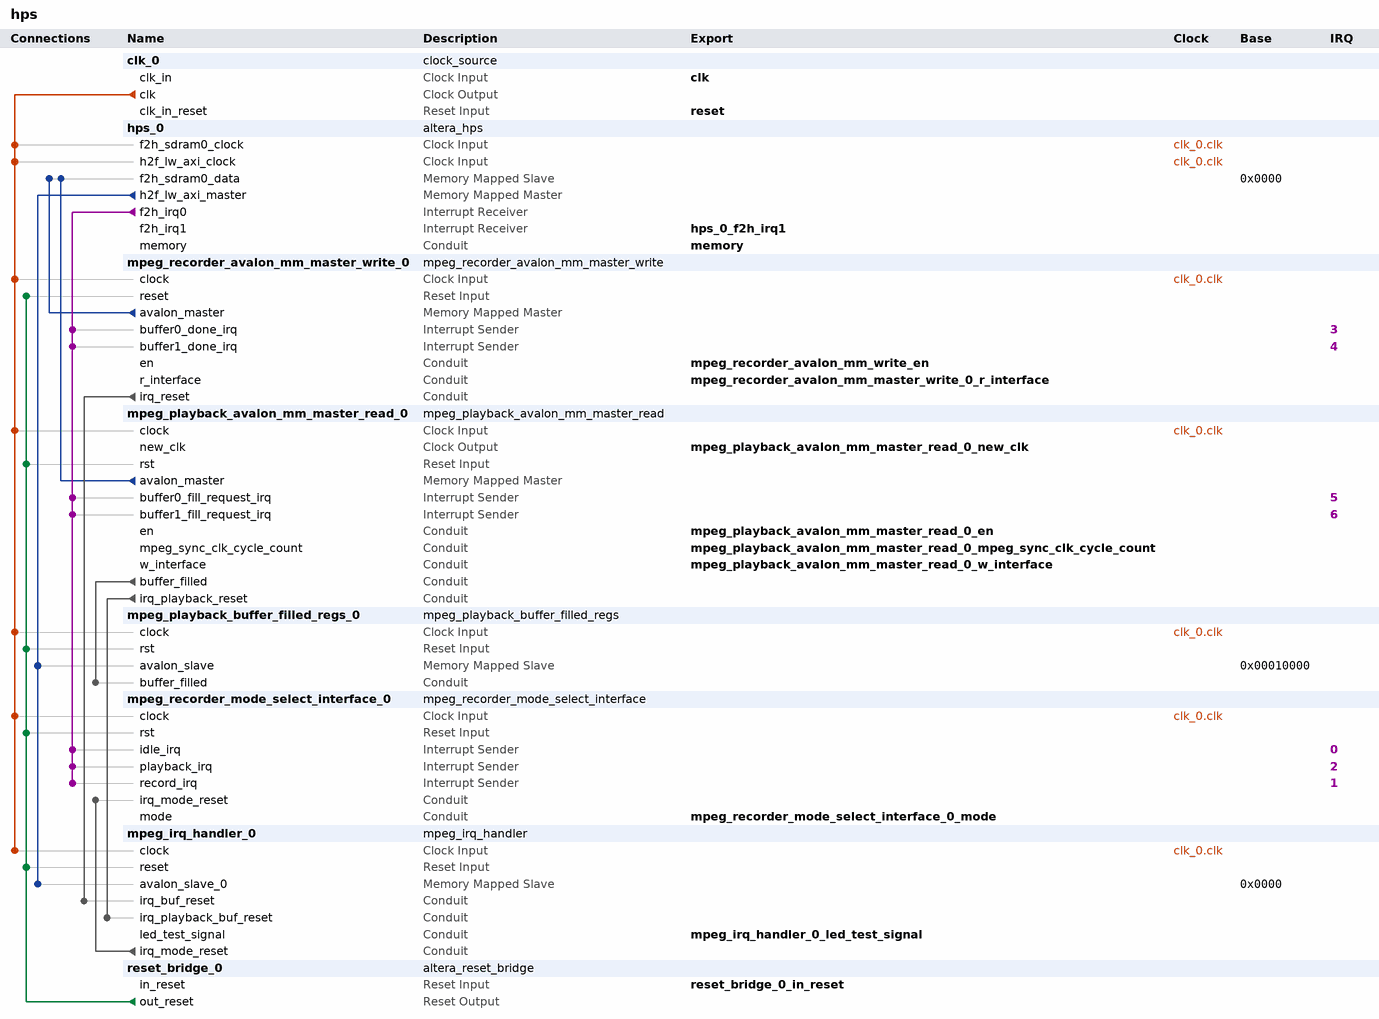
[diagram p0: system contents]
# Platform Designer (Qsys) system hps, Cyclone V 5CSEMA5F31C6
# Parameters at their usual value, and those the tool derives, are not listed.
package require -exact qsys 22.1
create_system hps
set_project_property DEVICE_FAMILY {Cyclone V}
set_project_property DEVICE 5CSEMA5F31C6

add_instance clk_0 clock_source 22.1
set_instance_parameter_value clk_0 clockFrequency 100000000

add_instance hps_0 altera_hps 22.1
set_instance_parameter_value hps_0 EMAC1_Mode N/A
set_instance_parameter_value hps_0 EMAC1_PinMuxing Unused
set_instance_parameter_value hps_0 F2SCLK_COLDRST_Enable false
set_instance_parameter_value hps_0 F2SCLK_DBGRST_Enable false
set_instance_parameter_value hps_0 F2SCLK_WARMRST_Enable false
set_instance_parameter_value hps_0 F2SDRAM_Type {Avalon-MM Bidirectional}
set_instance_parameter_value hps_0 F2SDRAM_Width 32
set_instance_parameter_value hps_0 F2SINTERRUPT_Enable true
set_instance_parameter_value hps_0 F2S_Width 0
set_instance_parameter_value hps_0 FPGA_PERIPHERAL_OUTPUT_CLOCK_FREQ_EMAC0_GTX_CLK 100
set_instance_parameter_value hps_0 FPGA_PERIPHERAL_OUTPUT_CLOCK_FREQ_EMAC0_MD_CLK 100.0
set_instance_parameter_value hps_0 FPGA_PERIPHERAL_OUTPUT_CLOCK_FREQ_EMAC1_GTX_CLK 100
set_instance_parameter_value hps_0 FPGA_PERIPHERAL_OUTPUT_CLOCK_FREQ_EMAC1_MD_CLK 100.0
set_instance_parameter_value hps_0 HPS_PROTOCOL DDR3
set_instance_parameter_value hps_0 I2C0_Mode N/A
set_instance_parameter_value hps_0 I2C0_PinMuxing Unused
set_instance_parameter_value hps_0 I2C1_Mode N/A
set_instance_parameter_value hps_0 I2C1_PinMuxing Unused
set_instance_parameter_value hps_0 LWH2F_Enable true
set_instance_parameter_value hps_0 MEM_BANKADDR_WIDTH 3
set_instance_parameter_value hps_0 MEM_CLK_FREQ 400.0
set_instance_parameter_value hps_0 MEM_COL_ADDR_WIDTH 10
set_instance_parameter_value hps_0 MEM_DQ_WIDTH 32
set_instance_parameter_value hps_0 MEM_DRV_STR RZQ/6
set_instance_parameter_value hps_0 MEM_ROW_ADDR_WIDTH 15
set_instance_parameter_value hps_0 MEM_RTT_NOM RZQ/6
set_instance_parameter_value hps_0 MEM_RTT_WR {Dynamic ODT off}
set_instance_parameter_value hps_0 MEM_TCL 7
set_instance_parameter_value hps_0 MEM_TFAW_NS 45.0
set_instance_parameter_value hps_0 MEM_TRAS_NS 36.0
set_instance_parameter_value hps_0 MEM_TRCD_NS 13.125
set_instance_parameter_value hps_0 MEM_TRFC_NS 300.0
set_instance_parameter_value hps_0 MEM_TRP_NS 13.125
set_instance_parameter_value hps_0 MEM_VENDOR JEDEC
set_instance_parameter_value hps_0 MEM_WTCL 7
set_instance_parameter_value hps_0 QSPI_Mode N/A
set_instance_parameter_value hps_0 QSPI_PinMuxing Unused
set_instance_parameter_value hps_0 REF_CLK_FREQ 25.0
set_instance_parameter_value hps_0 S2FCLK_USER2CLK 5
set_instance_parameter_value hps_0 S2F_Width 0
set_instance_parameter_value hps_0 SDIO_Mode N/A
set_instance_parameter_value hps_0 SDIO_PinMuxing Unused
set_instance_parameter_value hps_0 SPIM1_Mode N/A
set_instance_parameter_value hps_0 SPIM1_PinMuxing Unused
set_instance_parameter_value hps_0 STM_Enable false
set_instance_parameter_value hps_0 TIMING_BOARD_AC_SKEW 0.02
set_instance_parameter_value hps_0 TIMING_BOARD_AC_TO_CK_SKEW 0.01
set_instance_parameter_value hps_0 TIMING_BOARD_DQ_TO_DQS_SKEW 0.05
set_instance_parameter_value hps_0 TIMING_BOARD_MAX_CK_DELAY 0.03
set_instance_parameter_value hps_0 TIMING_BOARD_MAX_DQS_DELAY 0.02
set_instance_parameter_value hps_0 TIMING_BOARD_SKEW_BETWEEN_DQS 0.06
set_instance_parameter_value hps_0 TIMING_BOARD_SKEW_CKDQS_DIMM_MAX 0.12
set_instance_parameter_value hps_0 TIMING_BOARD_SKEW_CKDQS_DIMM_MIN 0.06
set_instance_parameter_value hps_0 TIMING_BOARD_SKEW_WITHIN_DQS 0.01
set_instance_parameter_value hps_0 TIMING_TDH 65
set_instance_parameter_value hps_0 TIMING_TDQSCK 255
set_instance_parameter_value hps_0 TIMING_TDQSQ 125
set_instance_parameter_value hps_0 TIMING_TDS 30
set_instance_parameter_value hps_0 TIMING_TIH 140
set_instance_parameter_value hps_0 TIMING_TIS 190
set_instance_parameter_value hps_0 TIMING_TQSH 0.4
set_instance_parameter_value hps_0 UART0_Mode N/A
set_instance_parameter_value hps_0 UART0_PinMuxing Unused
set_instance_parameter_value hps_0 USB1_Mode N/A
set_instance_parameter_value hps_0 USB1_PinMuxing Unused
set_instance_parameter_value hps_0 desired_cfg_clk_mhz 100.0
set_instance_parameter_value hps_0 desired_qspi_clk_mhz 400.0

add_instance mpeg_recorder_avalon_mm_master_write_0 mpeg_recorder_avalon_mm_master_write 1.0
set_instance_parameter_value mpeg_recorder_avalon_mm_master_write_0 ADDR_WIDTH 32
set_instance_parameter_value mpeg_recorder_avalon_mm_master_write_0 DATA_WIDTH 32

add_instance mpeg_playback_avalon_mm_master_read_0 mpeg_playback_avalon_mm_master_read 1.0
set_instance_parameter_value mpeg_playback_avalon_mm_master_read_0 ADDR_WIDTH 32
set_instance_parameter_value mpeg_playback_avalon_mm_master_read_0 BUF0_BASE_ADDR 838860800
set_instance_parameter_value mpeg_playback_avalon_mm_master_read_0 BUF1_BASE_ADDR 943718400
set_instance_parameter_value mpeg_playback_avalon_mm_master_read_0 BUFFER_LENGTH 104857600
set_instance_parameter_value mpeg_playback_avalon_mm_master_read_0 BUFFER_OFFSET 36
set_instance_parameter_value mpeg_playback_avalon_mm_master_read_0 DATA_WIDTH 32

add_instance mpeg_playback_buffer_filled_regs_0 mpeg_playback_buffer_filled_regs 1.0

add_instance mpeg_recorder_mode_select_interface_0 mpeg_recorder_mode_select_interface 1.0

add_instance mpeg_irq_handler_0 mpeg_irq_handler 1.0

add_instance reset_bridge_0 altera_reset_bridge 22.1
set_instance_parameter_value reset_bridge_0 ACTIVE_LOW_RESET 0
set_instance_parameter_value reset_bridge_0 SYNCHRONOUS_EDGES none

# connections
add_connection clk_0.clk hps_0.f2h_sdram0_clock clock
add_connection clk_0.clk hps_0.h2f_lw_axi_clock clock
add_connection clk_0.clk mpeg_irq_handler_0.clock clock
add_connection clk_0.clk mpeg_playback_avalon_mm_master_read_0.clock clock
add_connection clk_0.clk mpeg_playback_buffer_filled_regs_0.clock clock
add_connection clk_0.clk mpeg_recorder_avalon_mm_master_write_0.clock clock
add_connection clk_0.clk mpeg_recorder_mode_select_interface_0.clock clock
add_connection reset_bridge_0.out_reset mpeg_irq_handler_0.reset reset
add_connection reset_bridge_0.out_reset mpeg_playback_avalon_mm_master_read_0.rst reset
add_connection reset_bridge_0.out_reset mpeg_playback_buffer_filled_regs_0.rst reset
add_connection reset_bridge_0.out_reset mpeg_recorder_avalon_mm_master_write_0.reset reset
add_connection reset_bridge_0.out_reset mpeg_recorder_mode_select_interface_0.rst reset
add_connection hps_0.h2f_lw_axi_master mpeg_irq_handler_0.avalon_slave_0 avalon
set_connection_parameter_value hps_0.h2f_lw_axi_master/mpeg_irq_handler_0.avalon_slave_0 baseAddress 0x0000
add_connection hps_0.h2f_lw_axi_master mpeg_playback_buffer_filled_regs_0.avalon_slave avalon
set_connection_parameter_value hps_0.h2f_lw_axi_master/mpeg_playback_buffer_filled_regs_0.avalon_slave baseAddress 0x00010000
add_connection mpeg_playback_avalon_mm_master_read_0.avalon_master hps_0.f2h_sdram0_data avalon
set_connection_parameter_value mpeg_playback_avalon_mm_master_read_0.avalon_master/hps_0.f2h_sdram0_data baseAddress 0x0000
add_connection mpeg_recorder_avalon_mm_master_write_0.avalon_master hps_0.f2h_sdram0_data avalon
set_connection_parameter_value mpeg_recorder_avalon_mm_master_write_0.avalon_master/hps_0.f2h_sdram0_data baseAddress 0x0000
add_connection mpeg_irq_handler_0.irq_mode_reset mpeg_recorder_mode_select_interface_0.irq_mode_reset conduit
add_connection mpeg_playback_avalon_mm_master_read_0.buffer_filled mpeg_playback_buffer_filled_regs_0.buffer_filled conduit
add_connection mpeg_playback_avalon_mm_master_read_0.irq_playback_reset mpeg_irq_handler_0.irq_playback_buf_reset conduit
add_connection mpeg_recorder_avalon_mm_master_write_0.irq_reset mpeg_irq_handler_0.irq_buf_reset conduit
add_connection hps_0.f2h_irq0 mpeg_playback_avalon_mm_master_read_0.buffer0_fill_request_irq interrupt
set_connection_parameter_value hps_0.f2h_irq0/mpeg_playback_avalon_mm_master_read_0.buffer0_fill_request_irq irqNumber 5
add_connection hps_0.f2h_irq0 mpeg_playback_avalon_mm_master_read_0.buffer1_fill_request_irq interrupt
set_connection_parameter_value hps_0.f2h_irq0/mpeg_playback_avalon_mm_master_read_0.buffer1_fill_request_irq irqNumber 6
add_connection hps_0.f2h_irq0 mpeg_recorder_avalon_mm_master_write_0.buffer0_done_irq interrupt
set_connection_parameter_value hps_0.f2h_irq0/mpeg_recorder_avalon_mm_master_write_0.buffer0_done_irq irqNumber 3
add_connection hps_0.f2h_irq0 mpeg_recorder_avalon_mm_master_write_0.buffer1_done_irq interrupt
set_connection_parameter_value hps_0.f2h_irq0/mpeg_recorder_avalon_mm_master_write_0.buffer1_done_irq irqNumber 4
add_connection hps_0.f2h_irq0 mpeg_recorder_mode_select_interface_0.idle_irq interrupt
set_connection_parameter_value hps_0.f2h_irq0/mpeg_recorder_mode_select_interface_0.idle_irq irqNumber 0
add_connection hps_0.f2h_irq0 mpeg_recorder_mode_select_interface_0.playback_irq interrupt
set_connection_parameter_value hps_0.f2h_irq0/mpeg_recorder_mode_select_interface_0.playback_irq irqNumber 2
add_connection hps_0.f2h_irq0 mpeg_recorder_mode_select_interface_0.record_irq interrupt
set_connection_parameter_value hps_0.f2h_irq0/mpeg_recorder_mode_select_interface_0.record_irq irqNumber 1

# exported interfaces
add_interface clk clock sink
set_interface_property clk EXPORT_OF clk_0.clk_in
add_interface hps_0_f2h_irq1 interrupt receiver
set_interface_property hps_0_f2h_irq1 EXPORT_OF hps_0.f2h_irq1
add_interface memory conduit end
set_interface_property memory EXPORT_OF hps_0.memory
add_interface mpeg_irq_handler_0_led_test_signal conduit end
set_interface_property mpeg_irq_handler_0_led_test_signal EXPORT_OF mpeg_irq_handler_0.led_test_signal
add_interface mpeg_playback_avalon_mm_master_read_0_en conduit end
set_interface_property mpeg_playback_avalon_mm_master_read_0_en EXPORT_OF mpeg_playback_avalon_mm_master_read_0.en
add_interface mpeg_playback_avalon_mm_master_read_0_mpeg_sync_clk_cycle_count conduit end
set_interface_property mpeg_playback_avalon_mm_master_read_0_mpeg_sync_clk_cycle_count EXPORT_OF mpeg_playback_avalon_mm_master_read_0.mpeg_sync_clk_cycle_count
add_interface mpeg_playback_avalon_mm_master_read_0_new_clk clock source
set_interface_property mpeg_playback_avalon_mm_master_read_0_new_clk EXPORT_OF mpeg_playback_avalon_mm_master_read_0.new_clk
add_interface mpeg_playback_avalon_mm_master_read_0_w_interface conduit end
set_interface_property mpeg_playback_avalon_mm_master_read_0_w_interface EXPORT_OF mpeg_playback_avalon_mm_master_read_0.w_interface
add_interface mpeg_recorder_avalon_mm_master_write_0_r_interface conduit end
set_interface_property mpeg_recorder_avalon_mm_master_write_0_r_interface EXPORT_OF mpeg_recorder_avalon_mm_master_write_0.r_interface
add_interface mpeg_recorder_avalon_mm_write_en conduit end
set_interface_property mpeg_recorder_avalon_mm_write_en EXPORT_OF mpeg_recorder_avalon_mm_master_write_0.en
add_interface mpeg_recorder_mode_select_interface_0_mode conduit end
set_interface_property mpeg_recorder_mode_select_interface_0_mode EXPORT_OF mpeg_recorder_mode_select_interface_0.mode
add_interface reset reset sink
set_interface_property reset EXPORT_OF clk_0.clk_in_reset
add_interface reset_bridge_0_in_reset reset sink
set_interface_property reset_bridge_0_in_reset EXPORT_OF reset_bridge_0.in_reset

set_interconnect_requirement {$system} qsys_mm.clockCrossingAdapter HANDSHAKE
set_interconnect_requirement {$system} qsys_mm.enableEccProtection FALSE
set_interconnect_requirement {$system} qsys_mm.insertDefaultSlave FALSE
set_interconnect_requirement {$system} qsys_mm.maxAdditionalLatency 1

save_system hps.qsys
